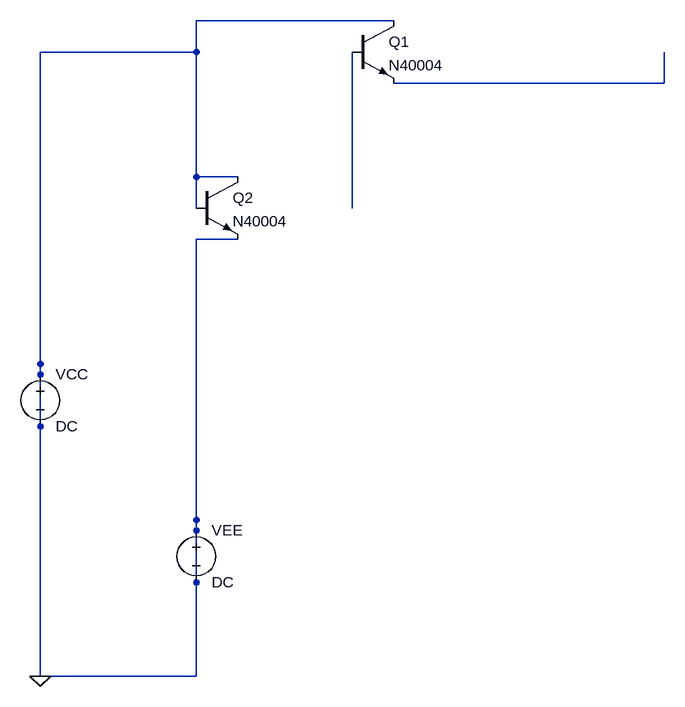
[diagram p0: schematic bjt_test.asc]
bjt_test.asc, the LTspice schematic file:
Version 4
SHEET 1 680 480
SYMBOL npn 720 192 R0
SYMATTR InstName Q1
SYMATTR Value N40004
SYMBOL npn 480 432 R0
SYMATTR InstName Q2
SYMATTR Value N40004
SYMBOL voltage 240 720 R0
SYMATTR InstName VCC
SYMATTR Value DC
FLAG 240 1200 0
SYMBOL voltage 480 960 R0
SYMATTR InstName VEE
SYMATTR Value DC
WIRE 240 1200 240 720
WIRE 480 976 480 720
WIRE 240 240 480 240
WIRE 240 240 240 736
WIRE 480 1200 240 1200
WIRE 480 1200 480 960
WIRE 784 192 480 192
WIRE 480 192 480 240
WIRE 720 240 720 480
WIRE 784 288 1200 288
WIRE 1200 288 1200 240
WIRE 544 432 480 432
WIRE 480 432 480 240
WIRE 480 480 480 240
WIRE 544 528 480 528
WIRE 480 528 480 720

The netlist it stands for:
* bjt_test.asc
Q1 0 N001 N002 0 N40004
Q2 0 0 0 0 N40004
VCC 0 0 DC
VEE 0 0 DC
.model NPN NPN
.model PNP PNP
.lib standard.bjt
.backanno
.end